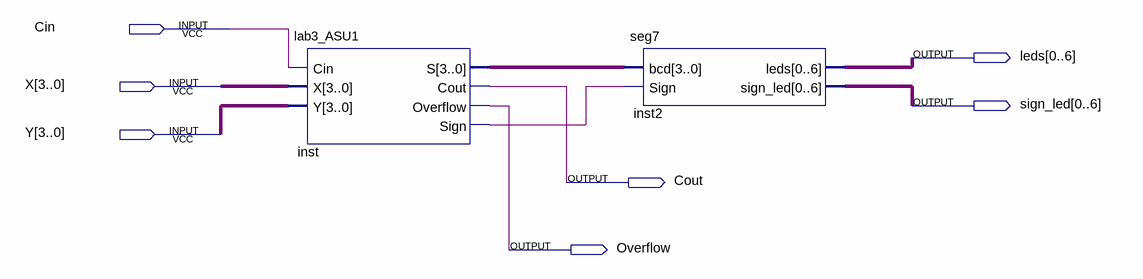
[diagram p0: schematic sheet]
// Quartus schematic lab3partA.bdf as structural Verilog: 2 symbols, 7 pins
module lab3partA (
  input  Cin,
  input  [3:0] X,
  input  [3:0] Y,
  output [0:6] leds,
  output [0:6] sign_led,
  output Cout,
  output Overflow
);

  wire inst_sign;
  wire [3:0] inst_s;

  lab3_ASU1 inst (.Cin(Cin), .X(X), .Y(Y), .S(inst_s), .Cout(Cout), .Overflow(Overflow), .Sign(inst_sign));
  seg7 inst2 (.bcd(inst_s), .Sign(inst_sign), .leds(leds), .sign_led(sign_led));
endmodule
